# Altium schematic sheet rev-b1_pod_Case.SchDoc
size 297 x 209 mm; Symbol: Drawing-Symbol_A4; @Project Name: Atrium_RevB1; @Page Count: 2; @Update Date: 2026-11-05; @Create Date: 2026-11-05; @Schematic Name: Schematic1; @Page No: 2; @Page Name: P1; Company: Local Forge; Version: V1.0; Page Size: A4; Drawn: Het Bhavsar; Device: Drawing-Symbol_A4; @Create Time: 20:16:00; @Update Time: 20:16:00; Border: 1; Width: 1170; Height: 825; Region Start: 1; X Region Count: 6; Y Region Count: 4; Blade Width: 10; Title Block Position: 3; @Board Name: Pod
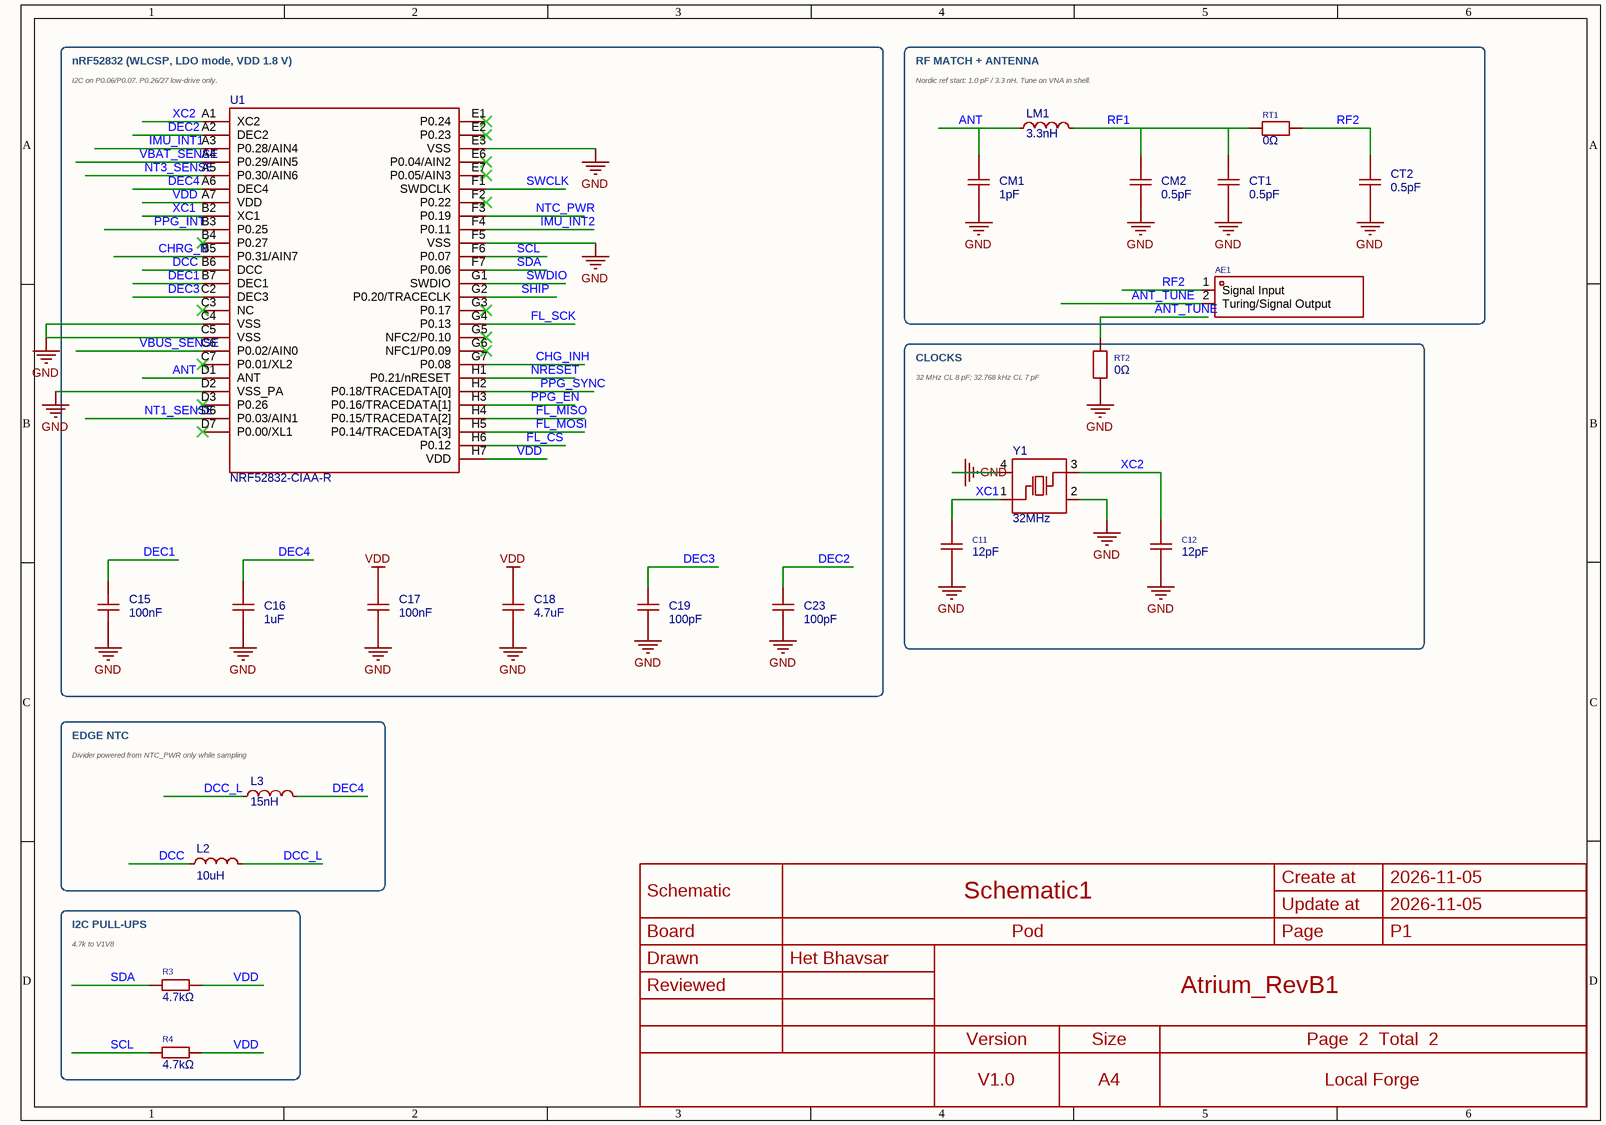
[diagram p0: rev-b1_pod_Case.SchDoc]

## Parts
AE1  H2U34C1H1B0100  [ANT-SMD_L2.0-W1.2-H2U34C1H1B0100]  (value not drawn)
C11  12pF  [C0201]
C12  12pF  [C0201]
C15  100nF  [C0201]
C16  1uF  [C0201]
C17  100nF  [C0201]
C18  4.7uF  [C0402]
C19  100pF  [C0201]
C23  100pF  [C0201]
CM1  1pF  [C0201]
CM2  0.5pF  [C0201]
CT1  0.5pF  [C0201]
CT2  0.5pF  [C0201]
L2  10uH  [IND-SMD_L1.0-W0.5-2]
L3  15nH  [L0402]
LM1  3.3nH  [L0201-RD]
R3  4.7kΩ  [R0201]
R4  4.7kΩ  [R0201]
RT1  0Ω  [R0201]
RT2  0Ω  [R0201]
U1  NRF52832-CIAA-R  [WLCSP-50_L3.2-W3.0-TL_NRF52832]
Y1  32MHz  [CRYSTAL-SMD_4P-L2.0-W1.6-BL]

## Blocks framed on the sheet
nRF52832 (WLCSP, LDO mode, VDD 1.8 V): C15-C19 C23 U1
RF MATCH + ANTENNA: AE1 CM1 CM2 CT1 CT2 LM1 RT1
CLOCKS: C11 C12 RT2 Y1
EDGE NTC: L2 L3
I2C PULL-UPS: R3 R4

## Nets
GND: C11.2 C12.2 C15.1 C16.2 C17.1 C18.2 C19.2 C23.2 CM1.1 CM2.2 CT1.2 CT2.2 RT2.2 U1.C4(VSS) U1.C5(VSS) U1.D2(VSS_PA) U1.E3(VSS) U1.F5(VSS) Y1.2(GND) Y1.4(GND)
VDD: C17.2 C18.1 R3.2 R4.2 U1.A7(VDD) U1.H7(VDD)
ANT: CM1.2 LM1.1 U1.D1(ANT)
ANT_TUNE: AE1.2(Turing/Signal_Output) RT2.1
CHG_INH: U1.G7(P0.08)
CHRG_N: U1.B5(P0.31/AIN7)
DCC: L2.1 U1.B6(DCC)
DCC_L: L2.2 L3.1
DEC1: C15.2 U1.B7(DEC1)
DEC2: C23.1 U1.A2(DEC2)
DEC3: C19.1 U1.C2(DEC3)
DEC4: C16.1 L3.2 U1.A6(DEC4)
FL_CS: U1.H6(P0.12)
FL_MISO: U1.H4(P0.15/TRACEDATA[2])
FL_MOSI: U1.H5(P0.14/TRACEDATA[3])
FL_SCK: U1.G4(P0.13)
IMU_INT1: U1.A3(P0.28/AIN4)
IMU_INT2: U1.F4(P0.11)
NRESET: U1.H1(P0.21/nRESET)
NT1_SENSE: U1.D6(P0.03/AIN1)
NT3_SENSE: U1.A5(P0.30/AIN6)
NTC_PWR: U1.F3(P0.19)
PPG_EN: U1.H3(P0.16/TRACEDATA[1])
PPG_INT: U1.B3(P0.25)
PPG_SYNC: U1.H2(P0.18/TRACEDATA[0])
RF1: CM2.1 CT1.1 LM1.2 RT1.1
RF2: AE1.1(Signal_Input) CT2.1 RT1.2
SCL: R4.1 U1.F6(P0.07)
SDA: R3.1 U1.F7(P0.06)
SHIP: U1.G2(P0.20/TRACECLK)
SWCLK: U1.F1(SWDCLK)
SWDIO: U1.G1(SWDIO)
VBAT_SENSE: U1.A4(P0.29/AIN5)
VBUS_SENSE: U1.C6(P0.02/AIN0)
XC1: C11.1 U1.B2(XC1) Y1.1(OSC1)
XC2: C12.1 U1.A1(XC2) Y1.3(OSC2)

Not connected (* = marked no-connect by the designer): U1 B4(P0.27)* C3(NC)* C7(P0.01/XL2)* D3(P0.26)* D7(P0.00/XL1)* E1(P0.24)* E2(P0.23)* E6(P0.04/AIN2)* E7(P0.05/AIN3)* F2(P0.22)* G3(P0.17)* G5(NFC2/P0.10)* G6(NFC1/P0.09)*

## Notes on the sheet
- (near U1) I2C on P0.06/P0.07. P0.26/27 low-drive only.
- (near LM1) Nordic ref start: 1.0 pF / 3.3 nH. Tune on VNA in shell.
- 32 MHz CL 8 pF; 32.768 kHz CL 7 pF
- (near L3) Divider powered from NTC_PWR only while sampling
- 4.7k to V1V8
- Create at
- 2026-11-05
- Schematic
- Board
- Schematic1
- Pod
- Update at
- Page
- P1
- Drawn
- Reviewed
- Het Bhavsar
- Atrium_RevB1
- Version
- V1.0
- Size
- A4
- Page  2  Total  2
- Local Forge

## Library data of the parts
AE1 = H2U34C1H1B0100: Antenna Type:Patch Antenna Frequency(Center/Band):2.442GHz Bandwidth:84MHz Peak Gain:1.9dBi Peak Gain:1.9dBi Impedance:50Ω Power:2W VSWR:- Operating Temperature:-40℃~+85℃ Operating Temperature:-40℃~+85℃ Connector Type:- Diameter (φD):- Length:2mm Width:1.; Manufacturer: Unictron(咏业); Add into BOM: yes; Bandwidth: 84MHz; Peak Gain: 1.9dBi; Impedance: 50Ω; Power: 2W; Symbol: H2U34C1H1B0100; Device: H2U34C1H1B0100; Convert to PCB: yes; Manufacturer Part: H2U34C1H1B0100; Supplier: LCSC; Supplier Part: C6204303; LCSC Part Name: 支持WiFi/蓝牙的表面贴装高性能小尺寸陶瓷芯片天线，符合RoHS、REACH、HF和AEC-Q200标准; Supplier Footprint: -; JLCPCB Part Class: Extended Part; Datasheet: https://item.szlcsc.com/datasheet/H2U34C1H1B0100/7149428.html; Antenna Type: Patch Antenna; Frequency(Center/Band): 2.442GHz; VSWR: -; Operating Temperature: -40℃~+85℃; Connector Type: -; Diameter (φD): -; Length: 2mm; Width: 1.2mm; Height: 0.6mm; FootprintName: ANT-SMD_L2.0-W1.2-H2U34C1H1B0100
C11 C12 = GRM0335C1H120JA01D: Capacitance: Tolerance:±5% Tolerance:±5% Voltage Rated: Temperature Coefficient:; Manufacturer: muRata(村田); Add into BOM: yes; Tolerance: ±5%; ModelId: c3e75c3d90204c70b153866ab54c789f0819f05c4eef4c71ace90d822a990e87; ModelName: C0201_L0.6-W0.3-H0.3; ModelTransform: 23.622,11.811,0,0,0,0,0,0,0; Symbol: GRM0335C1H120JA01D; Device: GRM0335C1H120JA01D; Convert to PCB: yes; Manufacturer Part: GRM0335C1H120JA01D; Supplier: LCSC; Supplier Part: C85890; Value: 12pF; JLCPCB Part Class: Extended Part; LCSC Part Name: 12pF ±5% 50V; Supplier Footprint: 0201; Datasheet: https://atta.szlcsc.com/upload/public/pdf/source/20200305/C490387_23319AE8C154DEB24C505E6C82A8106A.pdf; FootprintName: C0201
C15 = CL03A104KO3NNNC: Capacitance:100nF Tolerance:±10% Tolerance:±10% Voltage Rating:16V Temperature Coefficient:X5R; Manufacturer: SAMSUNG(三星); Add into BOM: yes; Tolerance: ±10%; Voltage Rating: 16V; Temperature Coefficient: X5R; ModelId: c3e75c3d90204c70b153866ab54c789f0819f05c4eef4c71ace90d822a990e87; ModelName: C0201_L0.6-W0.3-H0.3; ModelTransform: 23.622,11.811,0,0,0,0,0,0,0; Symbol: CL03A104KO3NNNC; Device: CL03A104KO3NNNC; Convert to PCB: yes; Manufacturer Part: CL03A104KO3NNNC; Supplier: LCSC; Supplier Part: C307380; LCSC Part Name: 100nF ±10% 16V; Supplier Footprint: 0201; JLCPCB Part Class: Extended Part; Datasheet: https://item.szlcsc.com/datasheet/CL03A104KO3NNNC/291054.html; Value: 100nF; FootprintName: C0201
C16 = GRM033R61A105ME15D: Capacitance:1uF Tolerance:±20% Tolerance:±20% Voltage Rating:10V Temperature Coefficient:X5R; Manufacturer: muRata(村田); Add into BOM: yes; Tolerance: ±20%; Voltage Rating: 10V; Temperature Coefficient: X5R; ModelId: c3e75c3d90204c70b153866ab54c789f0819f05c4eef4c71ace90d822a990e87; ModelName: C0201_L0.6-W0.3-H0.3; ModelTransform: 23.622,11.811,0,0,0,0,0,0,0; Symbol: GRM033R61A105ME15D; Device: GRM033R61A105ME15D; Convert to PCB: yes; Manufacturer Part: GRM033R61A105ME15D; Supplier: LCSC; Supplier Part: C181054; LCSC Part Name: 1uF ±20% 10V; Supplier Footprint: 0201; JLCPCB Part Class: Extended Part; Datasheet: https://item.szlcsc.com/datasheet/GRM033R61A105ME15D/192451.html; Value: 1uF; FootprintName: C0201
C17 = CL03A104KO3NNNC: Capacitance:100nF Tolerance:±10% Tolerance:±10% Voltage Rating:16V Temperature Coefficient:X5R; Manufacturer: SAMSUNG(三星); Add into BOM: yes; 3D Model: c3e75c3d90204c70b153866ab54c789f0819f05c4eef4c71ace90d822a990e87; 3D Model Transform: 23.622,11.811,0,0,0,0,0,0,0; Tolerance: ±10%; Voltage Rating: 16V; Temperature Coefficient: X5R; ModelName: C0201_L0.6-W0.3-H0.3; Symbol: CL03A104KO3NNNC; Device: CL03A104KO3NNNC; Convert to PCB: yes; LCSC Part Name: 100nF ±10% 16V; Supplier Part: C307380; Manufacturer Part: CL03A104KO3NNNC; Supplier Footprint: 0201; JLCPCB Part Class: Extended Part; Datasheet: https://item.szlcsc.com/datasheet/CL03A104KO3NNNC/291054.html; Supplier: LCSC; Value: 100nF; FootprintName: C0201
C18 = CL05A475MP5NRNC: Capacitance:4.7uF Tolerance:±20% Tolerance:±20% Voltage Rating:10V Temperature Coefficient:X5R; Manufacturer: SAMSUNG(三星); Add into BOM: yes; Tolerance: ±20%; Voltage Rating: 10V; Temperature Coefficient: X5R; ModelId: b7d13df3e9464d7a99d0651d1a5b4d570819f05c4eef4c71ace90d822a990e87; ModelName: C0402_L1.0-W0.5-H0.5; ModelTransform: 39.37,19.685,0,0,0,0,0,0,0; Symbol: CL05A475MP5NRNC; Device: CL05A475MP5NRNC; Convert to PCB: yes; Manufacturer Part: CL05A475MP5NRNC; Supplier: LCSC; Supplier Part: C23733; LCSC Part Name: 4.7uF ±20% 10V; Supplier Footprint: 0402; JLCPCB Part Class: Basic Part; Datasheet: https://item.szlcsc.com/datasheet/CL05A475MP5NRNC/24469.html; Value: 4.7uF; FootprintName: C0402
C19 C23 = GRM0335C1H101JA01D: Capacitance:100pF Tolerance:±5% Tolerance:±5% Voltage Rating:50V Temperature Coefficient:C0G; Manufacturer: muRata(村田); Add into BOM: yes; Tolerance: ±5%; Voltage Rating: 50V; Temperature Coefficient: C0G; ModelId: c3e75c3d90204c70b153866ab54c789f0819f05c4eef4c71ace90d822a990e87; ModelName: C0201_L0.6-W0.3-H0.3; ModelTransform: 23.622,11.811,0,0,0,0,0,0,0; Symbol: GRM0335C1H101JA01D; Device: GRM0335C1H101JA01D; Convert to PCB: yes; Manufacturer Part: GRM0335C1H101JA01D; Supplier: LCSC; Supplier Part: C76922; LCSC Part Name: 100pF ±5% 50V; Supplier Footprint: 0201; JLCPCB Part Class: Extended Part; Datasheet: https://item.szlcsc.com/datasheet/GRM0335C1H101JA01D/78049.html; Value: 100pF; FootprintName: C0201
CM1 = GJM0335C1H1R0BB01D: Capacitance: Voltage Rated: Temperature Coefficient:; Manufacturer: muRata(村田); Add into BOM: yes; ModelId: c3e75c3d90204c70b153866ab54c789f0819f05c4eef4c71ace90d822a990e87; ModelName: C0201_L0.6-W0.3-H0.3; ModelTransform: 23.622,11.811,0,0,0,0,0,0,0; Symbol: GJM0335C1H1R0BB01D; Device: GJM0335C1H1R0BB01D; Convert to PCB: yes; Manufacturer Part: GJM0335C1H1R0BB01D; Supplier: LCSC; Supplier Part: C237514; LCSC Part Name: 1pF 50V; Supplier Footprint: 0201; JLCPCB Part Class: Extended Part; Datasheet: https://atta.szlcsc.com/upload/public/pdf/source/20181211/C237514_B3409DDFEFAC0419E560973322D8BE24.pdf; Value: 1pF; FootprintName: C0201
CM2 CT1 CT2 = GRM0335C1HR50WA01D: Capacitance: Voltage Rating: Temperature Coefficient:; Manufacturer: muRata(村田); Add into BOM: no; Convert to PCB: yes; ModelId: c3e75c3d90204c70b153866ab54c789f0819f05c4eef4c71ace90d822a990e87; ModelName: C0201_L0.6-W0.3-H0.3; ModelTransform: 23.622,11.811,0,0,0,0,0,0,0; Symbol: GRM0335C1HR50WA01D; Device: GRM0335C1HR50WA01D; Manufacturer Part: GRM0335C1HR50WA01D; Supplier: LCSC; Supplier Part: C85922; LCSC Part Name: ±0.05pF 0.5pF 50V; Supplier Footprint: 0201; JLCPCB Part Class: Extended Part; Datasheet: https://atta.szlcsc.com/upload/public/pdf/source/20200305/C490387_23319AE8C154DEB24C505E6C82A8106A.pdf; Value: 0.5pF; FootprintName: C0201
L2 = LQW15DN100M00D: Inductance: Tolerance:±20% Tolerance:±20% Rated Current: Saturation Current (Isat):120mA DC Resistance (DCR):5.405Ω Type:- Ratings:-; Manufacturer: muRata(村田); Add into BOM: yes; Tolerance: ±20%; Saturation Current (Isat): 120mA; DC Resistance (DCR): 5.405Ω; ModelId: 8e9897b098ec43bf8ce18f07f94c83b40819f05c4eef4c71ace90d822a990e87; ModelTransform: 39.37,23.622,0,0,0,0,-0.513,0,0; Symbol: LQW15DN100M00D; Device: LQW15DN100M00D; Convert to PCB: yes; Manufacturer Part: LQW15DN100M00D; Supplier: LCSC; Supplier Part: C910650; LCSC Part Name: 10uH ±20% 120mA; Supplier Footprint: 0402; JLCPCB Part Class: Extended Part; Datasheet: https://atta.szlcsc.com/upload/public/pdf/source/20230630/1FD8E6B315B46B322CAEAF0711532ED5.pdf; Value: 10uH; Type: -; Ratings: -; FootprintName: IND-SMD_L1.0-W0.5-2; ModelName: IND-SMD_L1.0-W0.5-2
L3 = LQG15HS15NJ02D: Inductance:15nH Tolerance:±5% Tolerance:±5% Current Rating:450mA Current - Saturation (Isat):- DC Resistance(DCR):320mΩ Q @ Frequency:8@100MHz Frequency - Self Resonant:2.5GHz Ratings:-; Manufacturer: muRata(村田); Add into BOM: yes; Tolerance: ±5%; Current Rating: 450mA; DC Resistance(DCR): 320mΩ; Frequency - Self Resonant: 2.5GHz; ModelId: aef00b1603224fd68a96e37121ccc9160819f05c4eef4c71ace90d822a990e87; ModelName: L0402_L1.0-W0.5-H0.5_BEAD; ModelTransform: 39.37,19.685,0,0,0,0,0,0.0005,0; Symbol: LQG15HS15NJ02D; Device: LQG15HS15NJ02D; Convert to PCB: yes; Manufacturer Part: LQG15HS15NJ02D; Supplier: LCSC; Supplier Part: C86059; LCSC Part Name: 15nH ±5%; Supplier Footprint: 0402; JLCPCB Part Class: Extended Part; Datasheet: https://item.szlcsc.com/datasheet/LQG15HS15NJ02D/87235.html; Value: 15nH; Current - Saturation (Isat): -; Q @ Frequency: 8@100MHz; Ratings: -; FootprintName: L0402
LM1 = LQP03TN3N3B02D: Inductance: Tolerance:- Tolerance:- Rated Current: Current - Saturation (Isat):- DC Resistance (DCR): Q @ Freq:14@500MHz Frequency - Self Resonant: Ratings:; Manufacturer: muRata(村田); Add into BOM: yes; ModelId: d887176703ad44ad84b18f9ed82e768d0819f05c4eef4c71ace90d822a990e87; ModelTransform: 23.622,11.811,0,0,0,0,0,0,0; Symbol: LQP03TN3N3B02D; Device: LQP03TN3N3B02D; Convert to PCB: yes; Manufacturer Part: LQP03TN3N3B02D; Supplier: LCSC; Supplier Part: C98045; LCSC Part Name: 3.3nH ±0.1nH; Supplier Footprint: 0201; JLCPCB Part Class: Extended Part; Datasheet: https://atta.szlcsc.com/upload/public/pdf/source/20200107/C157592_7FF58F85BAEF0D918ADFA12AEC0AEBA8.pdf; Value: 3.3nH; Tolerance: -; Current - Saturation (Isat): -; Q @ Freq: 14@500MHz; FootprintName: L0201-RD; ModelName: L0201-RD
R3 R4 = 0201WMF4701TEE: Type:Thick Film Resistor Resistance:4.7kΩ Tolerance:±1% Tolerance:±1% Power(Watts):50mW Voltage-Supply(Max):25V Temperature Coefficient:±200ppm/℃ Temperature Coefficient:±200ppm/℃ Operating Temperature:-55℃~+155℃ Operating Temperature:-55℃~+155℃; Manufacturer: UNI-ROYAL(厚声); Add into BOM: yes; Tolerance: ±1%; Power(Watts): 50mW; Voltage-Supply(Max): 25V; ModelId: d3c6830bf3df48b598874c11a7d9c8170819f05c4eef4c71ace90d822a990e87; ModelName: R0201_L0.6-W0.3-H0.3; ModelTransform: 23.622,11.811,0,0,0,0,0,-0.0005,0; Symbol: 0201WMF4701TEE; Device: 0201WMF4701TEE; Convert to PCB: yes; Manufacturer Part: 0201WMF4701TEE; Supplier: LCSC; Supplier Part: C270346; Value: 4.7kΩ; JLCPCB Part Class: Extended Part; LCSC Part Name: 4.7kΩ ±1% 50mW 厚膜电阻; Supplier Footprint: 0201; Datasheet: https://item.szlcsc.com/datasheet/0201WMF4701TEE/259876.html; Type: Thick Film Resistor; Temperature Coefficient: ±200ppm/℃; Operating Temperature: -55℃~+155℃; FootprintName: R0201
RT1 = 0201WMF0000TEE: Type:Thick Film Resistor Resistance:0Ω Tolerance:±1% Tolerance:±1% Power(Watts):50mW Voltage-Supply(Max):25V Temperature Coefficient:- Temperature Coefficient:- Operating Temperature:-55℃~+155℃ Operating Temperature:-55℃~+155℃; Manufacturer: UNI-ROYAL(厚声); Add into BOM: yes; Tolerance: ±1%; Power(Watts): 50mW; Voltage-Supply(Max): 25V; ModelId: d3c6830bf3df48b598874c11a7d9c8170819f05c4eef4c71ace90d822a990e87; ModelName: R0201_L0.6-W0.3-H0.3; ModelTransform: 23.622,11.811,0,0,0,0,0,-0.0005,0; Symbol: 0201WMF0000TEE; Device: 0201WMF0000TEE; Convert to PCB: yes; Manufacturer Part: 0201WMF0000TEE; Supplier: LCSC; Supplier Part: C473473; JLCPCB Part Class: Extended Part; Value: 0Ω; LCSC Part Name: 0Ω ±1% 50mW 厚膜电阻; Supplier Footprint: 0201; Datasheet: https://item.szlcsc.com/datasheet/0201WMF0000TEE/479866.html; Type: Thick Film Resistor; Temperature Coefficient: -; Operating Temperature: -55℃~+155℃; FootprintName: R0201
RT2 = 0201WMF0000TEE: Type:Thick Film Resistor Resistance:0Ω Tolerance:±1% Tolerance:±1% Power(Watts):50mW Voltage-Supply(Max):25V Temperature Coefficient:- Temperature Coefficient:- Operating Temperature:-55℃~+155℃ Operating Temperature:-55℃~+155℃; Manufacturer: UNI-ROYAL(厚声); Add into BOM: yes; 3D Model: d3c6830bf3df48b598874c11a7d9c8170819f05c4eef4c71ace90d822a990e87; 3D Model Transform: 23.622,11.811,0,0,0,0,0,-0.0005,0; Tolerance: ±1%; Power(Watts): 50mW; Voltage-Supply(Max): 25V; ModelName: R0201_L0.6-W0.3-H0.3; Symbol: 0201WMF0000TEE; Device: 0201WMF0000TEE; Convert to PCB: yes; LCSC Part Name: 0Ω ±1% 50mW 厚膜电阻; Supplier Footprint: 0201; Datasheet: https://item.szlcsc.com/datasheet/0201WMF0000TEE/479866.html; Type: Thick Film Resistor; Temperature Coefficient: -; Operating Temperature: -55℃~+155℃; Manufacturer Part: 0201WMF0000TEE; Supplier: LCSC; Supplier Part: C473473; JLCPCB Part Class: Extended Part; Value: 0Ω; FootprintName: R0201
U1 = NRF52832-CIAA-R: Frequency Range:2.4GHz~2.4835GHz Frequency Range:2.4GHz~2.4835GHz Interface:I2S；UART；SPI Voltage - Supply:1.7V~3.6V Voltage - Supply:1.7V~3.6V Applications:Bluetooth Output Power:4dBm Data Rate:2Mbps Current Of Transmitting:5.3mA Sensitivity:-96dBm Receiv; Manufacturer: NORDIC; Add into BOM: yes; Output Power: 4dBm; Data Rate: 2Mbps; Current Of Transmitting: 5.3mA; Sensitivity: -96dBm; Receive Current: 5.4mA; Typical Application Frequency: 2.4GHz; ModelId: 1576cd53141c4e44b7a8ff53a3ab85980819f05c4eef4c71ace90d822a990e87; ModelName: WLCSP-50_L3.2-W3.0-H0.4-TL_NRF52832; ModelTransform: 118.11,125.984,0,0,0,0,0,0,0; Symbol: NRF52832-CIAA-R; Device: NRF52832-CIAA-R; Convert to PCB: yes; Manufacturer Part: NRF52832-CIAA-R; Supplier: LCSC; Supplier Part: C509405; LCSC Part Name: 2.4 GHz收发器，蓝牙低功耗模式，ARM Cortex-M4处理器，多协议支持; Supplier Footprint: WLCSP-50(3x3.2); JLCPCB Part Class: Extended Part; Datasheet: https://item.szlcsc.com/datasheet/NRF52832-CIAA-R/523264.html; Frequency Range: 2.4GHz~2.4835GHz; Interface: I2S；UART；SPI; Voltage - Supply: 1.7V~3.6V; Applications: Bluetooth; Operating Temperature: -40℃~+85℃; Type: transceiver; Features: CRC check function；Supports RSSI function; FootprintName: WLCSP-50_L3.2-W3.0-TL_NRF52832
Y1 = XRCGB32M000F1S1BR0: Frequency:32MHz Normal temperature Frequency Tolerance:±10ppm Normal temperature Frequency Tolerance:±10ppm Load Capacitance:8pF Frequency Stability:±10ppm Frequency Stability:±10ppm Equivalent Series Resistance(ESR):50Ω Operating Temperature:-30℃~+85℃ Op; Manufacturer: muRata(村田); Add into BOM: yes; Normal temperature Frequency Tolerance: ±10ppm; Load Capacitance: 8pF; Equivalent Series Resistance(ESR): 50Ω; ModelId: 7de1fd6717b24eac901503d31586dc410819f05c4eef4c71ace90d822a990e87; ModelTransform: 80.709,64.961,0,0,0,0,0,0,0; Symbol: XRCGB32M000F1S1BR0; Device: XRCGB32M000F1S1BR0; Convert to PCB: yes; Manufacturer Part: XRCGB32M000F1S1BR0; Supplier: LCSC; Supplier Part: C6938063; LCSC Part Name: 32MHz ±10ppm 8pF; Supplier Footprint: SMD2016-4P; JLCPCB Part Class: Extended Part; Datasheet: https://item.szlcsc.com/datasheet/XRCGB32M000F1S1BR0/7903657.html; Value: 32MHz; Frequency Stability: ±10ppm; Operating Temperature: -30℃~+85℃; FootprintName: CRYSTAL-SMD_4P-L2.0-W1.6-BL; ModelName: CRYSTAL-SMD_4P-L2.0-W1.6-BL